# Altium schematic sheet Vehicle_Power.SchDoc
size A; Author: Jared Ainsworth; CompanyName: UpRev LLC; Engineer: Jared Ainsworth; Organization: UpRev LLC; Address1: 4807 Commercial Park Dr.; Address2: Austin, TX 78724; Address3: United States; Address4: www.UpRev.com; SheetNumber: 11; SheetTotal: 13
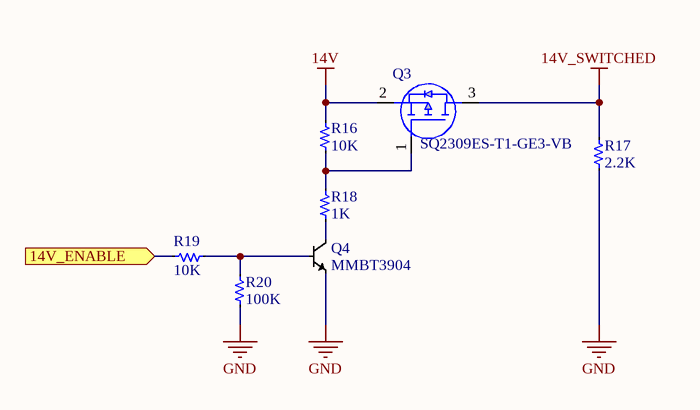
[diagram p0: Vehicle_Power.SchDoc]

## Parts
Q3  SQ2309ES-T1-GE3-VB  [SOT-23-3]
Q4  MMBT3904  [SOT-23-3]
R16  10K  [R0402 (1005)]
R17  2.2K  [R1206 (3216)]
R18  1K  [R0402 (1005)]
R19  10K  [R0402 (1005)]
R20  100K  [R0402 (1005)]

## Ports
14V_ENABLE (in, see Power_Supplies[2C], Dev_Board_Connection[2B], Power_Supplies[2C])

## Nets
14V: Q3.2(S) R16.2
14V_SWITCHED: Q3.3(D) R17.2
GND: Q4.2(C) R17.1 R20.1
14V_ENABLE: R19.2 ; port 14V_ENABLE
NetQ3_1: Q3.1(G) R16.1 R18.2
NetQ4_1: Q4.1(B) R19.1 R20.2
NetQ4_3: Q4.3(E) R18.1

## Notes on the sheet
- Title
- Size:
- Engineer:
- A
- Number:
- Revision:
- Sheet
- of
- File:

## Library data of the parts
Q3 = SQ2309ES-T1-GE3-VB: MOSFET P-Channel, 60V, VBsemi Elec SQ2309ES-T1-GE3-VB; Manufacturer: VBsemi Elec; Manufacturer Part Number: SQ2309ES-T1-GE3-VB; LCSC Part Number: C6705325; Package: SOT-23(TO-236)
Q4 = MMBT3904(RANGE:100-300): NPN Bipolar Transistor (BJT), 40V, 200mA, SOT-23-3; Manufacturer: Jiangsu Changjing Electronics Technology Co., Ltd.; Package: SOT-23; LCSC Part Number: C20526; Manufacturer Part Number: MMBT3904(RANGE:100-300)
R16 R19 = 10K ohm, 0402 (1005): 10K ohm, Resistor, ±1%, 0402 (1005); Manufacturer: Ever Ohms Tech; Manufacturer Part Number: CR0402F10K0Q10Z; Power: 100mW; Package: 0402 (1005 metric); LCSC Part Number: C881209; Value: 10K
R17 = 2.2K ohm, 1206 (3216): 2.2K ohm, Resistor, ±1%, 1/4W, 1206 (3216); Manufacturer: UNI-ROYAL(Uniroyal Elec); Manufacturer Part Number: 1206W4F2201T5E; Package: 1206 (3216 metric); LCSC Part Number: C17948; Value: 2.2K
R18 = 1K ohm, 0402 (1005): 1K ohm, Resistor, ±1%, 0402 (1005); Manufacturer: UNI-ROYAL(Uniroyal Elec); Manufacturer Part Number: 0402WGF1001TCE; Package: 0402 (1005 metric); Cost: 0.013; LCSC Part Number: C11702; Value: 1K
R20 = 100K ohm, 0402 (1005): 100K ohm, Resistor, ±1%, 0402 (1005); Manufacturer: UNI-ROYAL(Uniroyal Elec); Manufacturer Part Number: 0402WGF1003TCE; Package: 0402 (1005 metric); Part Number: 0402WGF1003TCE; LCSC Part Number: C25741; Value: 100K